# Altium schematic sheet Sheet7.SchDoc
size A; SheetNumber: 7; SheetTotal: 10
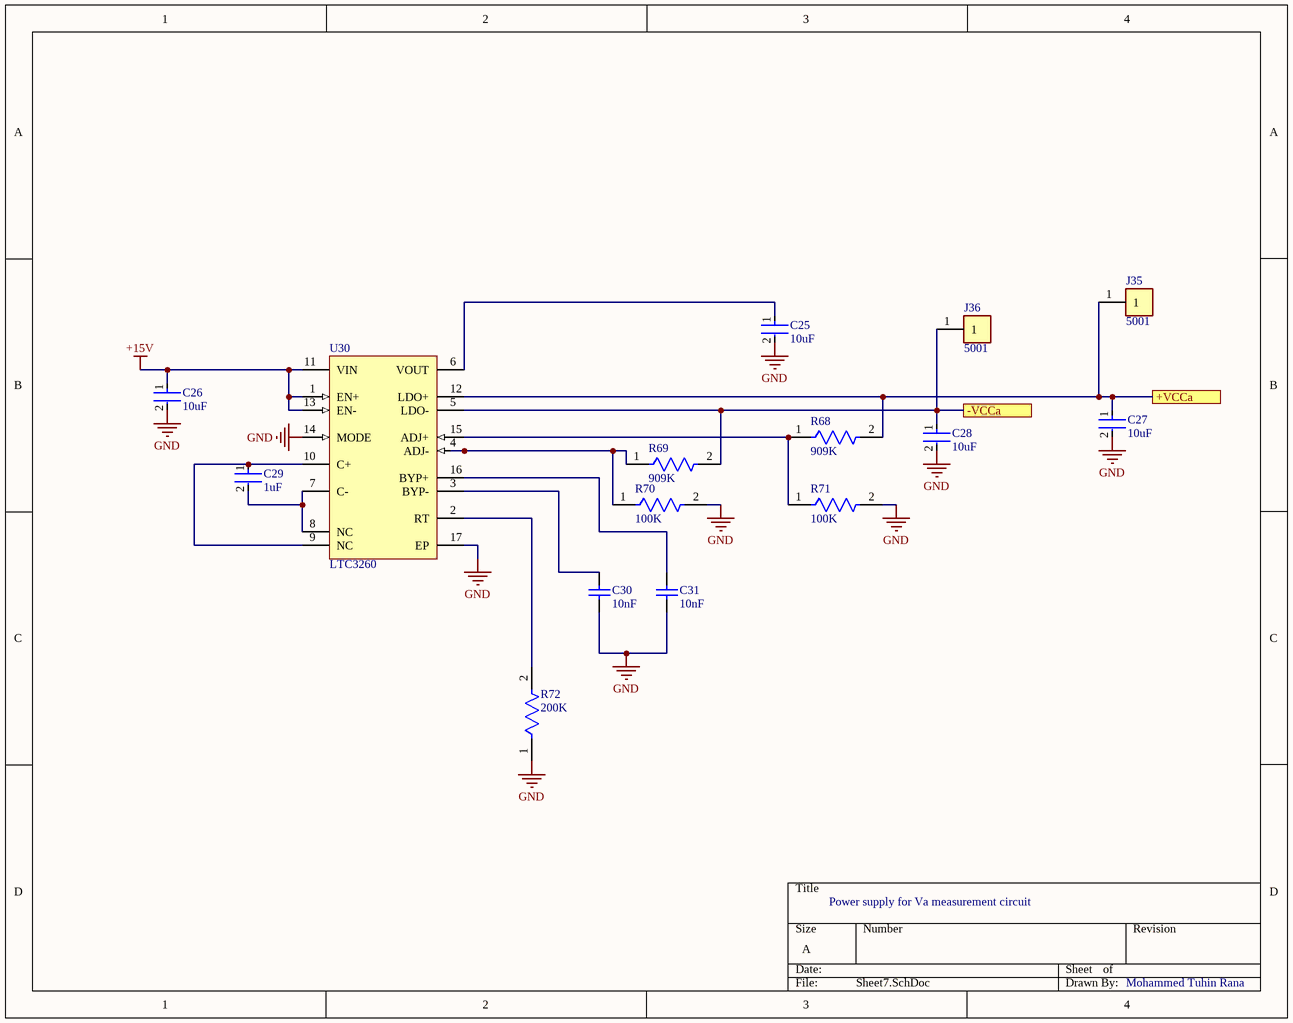
[diagram p0: Sheet7.SchDoc]

## Parts
C25  10uF  [FP-C1210C106M6PACTU-MFG]
C26  10uF  [FP-C1210C106M6PACTU-MFG]
C27  10uF  [FP-C1210C106M6PACTU-MFG]
C28  10uF  [FP-C1210C106M6PACTU-MFG]
C29  1uF  [FP-GRM55D-0_4-IPC_A]
C30  10nF  [CAPC2013X100X50NL20T25]
C31  10nF  [CAPC2013X100X50NL20T25]
J35  5001  [FP-5001-MFG]
J36  5001  [FP-5001-MFG]
R68  909K  [FP-CRCW1206-e3-IPC_C]
R69  909K  [FP-CRCW1206-e3-IPC_C]
R70  100K  [FP-AC1206-MFG]
R71  100K  [FP-AC1206-MFG]
R72  200K  [FP-CRCW1206-e3-MFG]
U30  LTC3260  [LT-MSE-16-EDP_L]

## Ports
+VCCa (see Sheet3[1A], Sheet3[1C], Sheet3[2A], Sheet3[2B], Sheet3[3B], Sheet3[3C], Sheet3[4B]), -VCCa (see Sheet3[1B], Sheet3[1D], Sheet3[2B], Sheet3[2C], Sheet3[3C], Sheet3[3D], Sheet3[4C])

## Nets
+15V: C26.1 U30.1(EN+) U30.11(VIN) U30.13(EN-)
GND: C25.2 C26.2 C27.2 C28.2 C30.1 C31.1 R70.2 R71.2 R72.1 U30.14(MODE) U30.17(EP)
+VCCa: C27.1 J35.1 R68.2 U30.12(LDO+) ; port +VCCa
-VCCa: C28.1 J36.1 R69.2 U30.5(LDO-) ; port -VCCa
NetC25_1: C25.1 U30.6(VOUT)
NetC29_1: C29.1 U30.9(NC) U30.10(C+)
NetC29_2: C29.2 U30.7(C-) U30.8(NC)
NetC30_2: C30.2 U30.3(BYP-)
NetC31_2: C31.2 U30.16(BYP+)
NetR68_1: R68.1 R71.1 U30.15(ADJ+)
NetR69_1: R69.1 R70.1 U30.4(ADJ-)
NetR72_2: R72.2 U30.2(RT)

## Notes on the sheet
- Power supply for Va measurement circuit
- Mohammed Tuhin Rana

## Library data of the parts
C25-C28 = CMP-1038-02235-2: CAP CER 10UF 35V X5R 1210; Dissipation Factor: 2.5%; Tolerance: 20%; Dielectric Material: Ceramic; Voltage: 35V; Package Quantity: 2000; Series: C; Case Code (Metric): 3225; Length: 3.2mm; Dielectric: X5R; Height: 1.9mm; Max Operating Temperature: 85°C; Termination: SMD/SMT; Case/Package: 1210; Min Operating Temperature: -55°C; Depth: 2.5mm; Packaging: Tape and Reel; Case Code (Imperial): 1210; Width: 2.5mm; Radiation Hardening: No; Voltage Rating: 35V; Mount: Surface Mount; Voltage Rating (DC): 35V; Capacitance: 10uF; Thickness: 0.083inch; Construction: Flat; REACH SVHC: No SVHC
C29 = CMP-2000-06370-2: Chip Multilayer Ceramic Capacitors for General Purpose, 2220, 1.0uF, X7R, 15%, 10%, 250V; Width: 5mm; Capacitance: 1uF; Height: 2mm; Case Code (Imperial): 2220; Voltage Rating (DC): 250V; Max Operating Temperature: 125°C; Number of Pins: 2; Min Operating Temperature: -55°C; Termination: SMD/SMT; Case/Package: 2220; Dielectric: X7R; Material: Ceramic; REACH SVHC: No SVHC; Voltage: 250V; Packaging: Tape and Reel; Thickness: 0.087inch; Depth: 5mm; Package Quantity: 1; Tolerance: 10%; Mount: Surface Mount; Voltage Rating: 250V; Length: 5.7mm; Case Code (Metric): 5750; Lead Free: Lead Free
C30 C31 = CMP-2007-03708-1: Part Number: C0805F103K5RACTU; Manufacturer: Kemet
J35 J36 = CMP-2000-05181-2: PC TEST POINT MINIATURE BLACK; Body Material: Bronze; Plating: Silver; Inside Diameter: 1.27mm; Hole Diameter: 1.6mm; Number of Ports: 1; Outside Diameter: 2.54mm; Insulation: Insulated; Insulation Material: Nylon; Mount: Through Hole; RoHS Compliant: Yes; Series: THM; Height: 0.3inch; Termination: Through Hole; Material: Nylon; Packaging: Bulk; Contact Material: Bronze; REACH SVHC: No SVHC; Contact Plating: Silver; Orientation: Straight; Lead Free: Lead Free; Package Quantity: 100; Length: 7.62mm; Flammability Rating: UL94 V-0; Number of Contacts: 1; Diameter: 2.54mm; Housing Color: Black; Color: Black
R68 R69 = CMP-2003-02425-2: RES Thick Film, 909kΩ, 1%, 0.25W, 100ppm/°C, 1206; Resistance: 909kR; Power Rating: 250mW; Voltage Rating: 200V; Contact Plating: Tin; Number of Terminations: 2; Package Quantity: 10; Case Code (Imperial): 1206; Features: Automotive AEC-Q200; Termination: SMD/SMT; Lead Free: Lead Free; Depth: 1.6mm; Min Operating Temperature: -55°C; Case/Package: 1206; Width: 1.6mm; Tolerance: 1%; Military Standard: Not; Voltage Rating (DC): 200V; Composition: Thick Film; Radiation Hardening: No; Max Power Dissipation: 250mW; Packaging: Tape and Reel; Case Code (Metric): 3216; Height: 0.024inch; Temperature Coefficient: 100ppm/°C; Max Operating Temperature: 155°C; Length: 3.2mm; Weight: 0.000353oz
R70 R71 = CMP-2003-04909-2: RES SMD 100K OHM 1% 1/4W 1206; Manufacturer: Yageo; Manufacturer Part Number: AC1206FR-07100KL; Resistance: 100KΩ; Power Rating: 0.25W; Value: 100KΩ; Voltage Rating: 200V; Automotive Grade: Grade 0; Tolerance: 0.01; Mouser Description: RES SMD 100K OHM 1% 1/4W 1206; Ipc Land Pattern Name: RESC310160X55; Temperature Range Low: -55°C; Package: AC1206; Temperature: -55°C to +155°C; Device Class L3: Chip SMD Resistors; Lead Free: Yes; Temperature Range High: +155°C; Series: AC; Octopart: https://octopart.com/ac1206fr-07100kl-yageo-21711116; Height: 0.65mm; Footprint Url: http://www.yageo.com/exep/pages/download/literatures/PYu-R_Mount_10.pdf; RoHS: TRUE; Category: Res; Automotive: Yes; Composition: Thick Film; Device Class L2: Resistors; ComponentLink2URL: http://www.yageo.com/NewPortal/yageodocoutput?fileName=/pdf/R-Chip/PYu-AC_51_RoHS_L_6.pdf; Digikey Description: RES SMD 100K OHM 1% 1/4W 1206; ComponentLink2Description: Datasheet; Device Class L1: Passive Components
R72 = CMP-2003-01933-2: RES Thick Film, 200kΩ, 1%, 0.25W, 100ppm/°C, 1206; Power Rating: 250mW; Resistance: 200kR; Working Voltage: 200V; Case Code (Metric): 3216; Tolerance: 1%; Mount: Surface Mount; Packaging: Tape and Reel; Case Code (Imperial): 1206; Depth: 1.6mm; Military Standard: Not; Max Operating Temperature: 155°C; Length: 3.2mm; Radiation Hardening: No; Number of Terminations: 2; Features: Automotive AEC-Q200; Width: 1.6mm; Lead Free: Lead Free; Composition: Thick Film; Package Quantity: 10; Min Operating Temperature: -55°C; Contact Plating: Tin; Voltage Rating (DC): 200V; Temperature Coefficient: 100ppm/°C; Height: 0.55mm; Weight: 0.000353oz; Case/Package: 1206; Voltage Rating: 200V; Termination: SMD/SMT; Max Power Dissipation: 250mW
U30 = CMP-0475-00260-1: Low Noise Dual Supply Inverting Charge Pump, 4.5 to 32 V Vin, Adjustable Vout, 16-pin SOP (MSE-16-EDP), -40 to 125 degC, Pb-Free, Tape and Reel; PartNumber: LTC3260EMSE#TRPBF; Manufacturer: Linear Technology; Max Iout(mA): 100; Isupply(mA): 0.1; Ishutdown(uA): 2; Vin Min(V): 4.5; Frequency(kHz): 500; Vin Max(V): 32; Voutput: Adj; ComponentLink2URL: http://cds.linear.com/docs/en/datasheet/3260fa.pdf; PackageReference: MSE-16; Mounting Technology: Surface Mount; DatasheetVersion: Rev. A; ComponentLink3URL: http://cds.linear.com/docs/en/packaging/05081667_F_MSE16.pdf; ComponentLink1Description: Manufacturer URL; ComponentLink1URL: http://www.linear.com/; Packing: Tape and Reel; RoHS: TRUE; PackageDescription: 16-Pin Plastic MSOP, Exposed Die Pad, Body 4.039 x 3 mm, Pitch 0.5 mm; ComponentLink3Description: Package Specification; ComponentLink2Description: Datasheet; PackageVersion: Rev. F, 05/2013